# EAGLE design BPv3-LCDadapter-v2c (EAGLE 5.11)
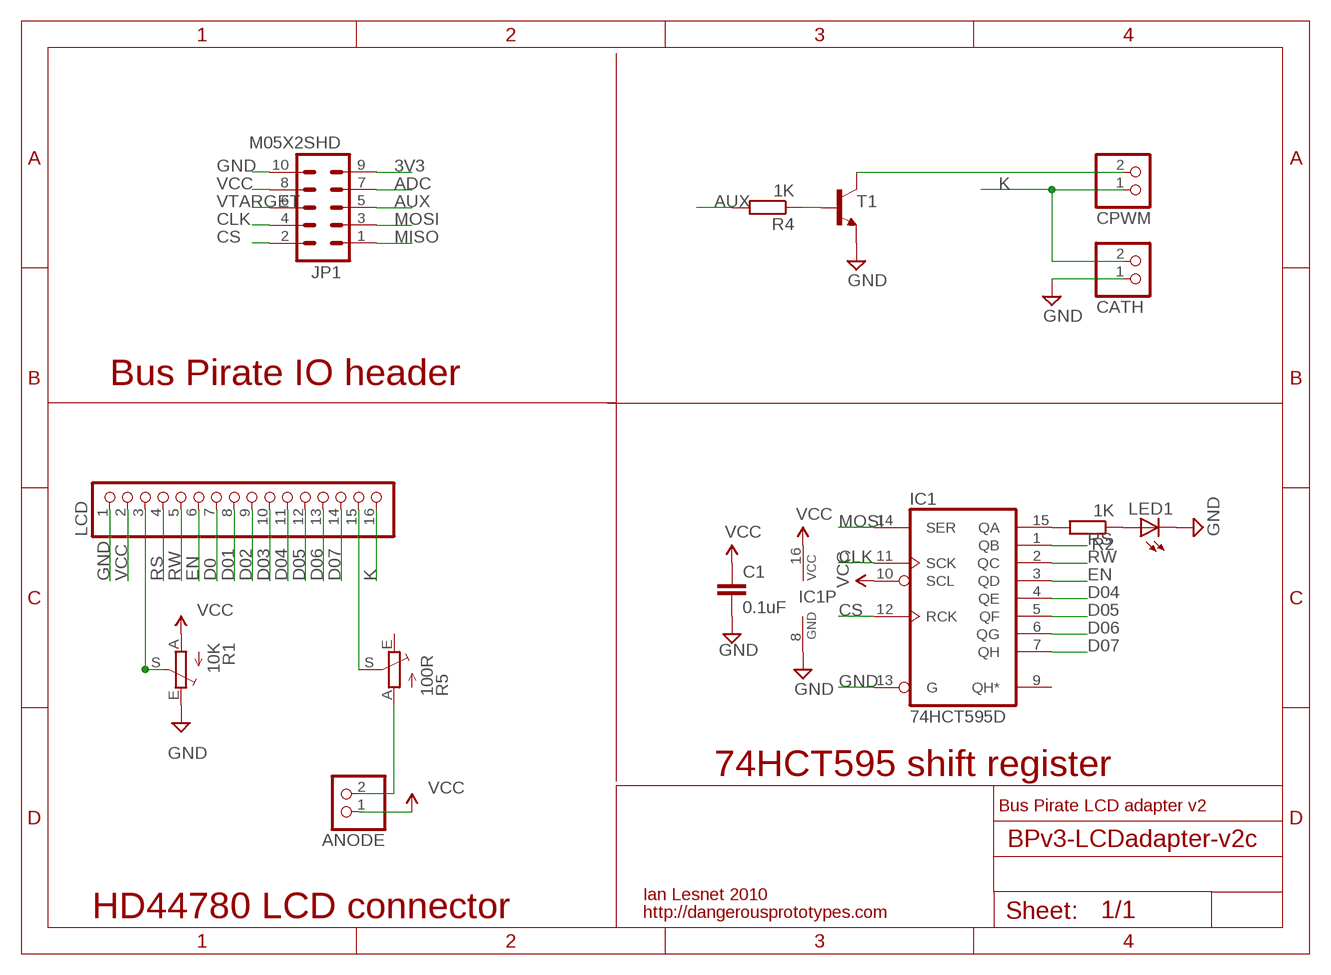
[diagram p0: schematic, sheet 1]

## Parts
ANODE  PINHD-1X2  [1X02]
C1  0.1uF  C-EUC0805  [C0805]
CATH  PINHD-1X2  [1X02]
CPWM  PINHD-1X2  [1X02]
IC1  74HCT595D  74HC595D  [SO16]
JP1  M05X2SHD  [2X5-SHROUDED]
LCD  PINHD-1X16  [1X16]
LED1  LEDCHIP-LED0805  [CHIP-LED0805]
R1  10K  TRIM_EU-CA6V  [CA6V]
R2  1K  R-EU_M0805  [M0805]
R4  1K  R-EU_M0805  [M0805]
R5  100R  TRIM_EU-CA6V  [CA6V]
T1  NPNSOT23BEC  [SOT23-BEC]

## Nets
3V3: JP1.9
ADC: JP1.7
AUX: JP1.5 R4.2
CLK: IC1.11(SCK) JP1.4
CS: IC1.12(RCK) JP1.2
D0: LCD.7
D01: LCD.8
D02: LCD.9
D03: LCD.10
D04: IC1.4(QE) LCD.11
D05: IC1.5(QF) LCD.12
D06: IC1.6(QG) LCD.13
D07: IC1.7(QH) LCD.14
EN: IC1.3(QD) LCD.6
GND: C1.2 CATH.1 IC1.8(GND) IC1.13(G) JP1.10 LCD.1 LED1.C R1.E T1.E
K: CATH.2 CPWM.1 LCD.16
MISO: JP1.1
MOSI: IC1.14(SER) JP1.3
N$1: IC1.15(QA) R2.2
N$2: LED1.A R2.1
N$3: ANODE.2 R5.A
N$4: LCD.15 R5.S
N$6: CPWM.2 T1.C
N$7: LCD.3 R1.S
N$8: R4.1 T1.B
RS: IC1.1(QB) LCD.4
RW: IC1.2(QC) LCD.5
VCC: ANODE.1 C1.1 IC1.10(SCL) IC1.16(VCC) JP1.8 LCD.2 R1.A
VTARGET: JP1.6
Unconnected: IC1.9(QH*) R5.E

## Notes on the sheet
- Bus Pirate IO header
- 74HCT595 shift register
- Bus Pirate LCD adapter v2
- Ian Lesnet 2010
- HD44780 LCD connector | http://dangerousprototypes.com

## Library data of the parts
ANODE CATH CPWM = pinhead - Copy:PINHD-1X2: PIN HEADER
C1 = rcl:C-EU: CAPACITOR, European symbol
IC1 = 74xx-eu:74*595: 8-bit SHIFT REGISTER, output latch
JP1 = SparkFun:M05X2: Header 5x2 Standard 10-pin dual row 0.1" header. Commonly used with AVR-ISP. Use with Spark Fun Electronics SKU: PRT-00778
LCD = pinhead:PINHD-1X16: PIN HEADER
LED1 = led:LED: LED OSRAM: - CHIPLED LG R971, LG N971, LY N971, LG Q971, LY Q971, LO R971, LY R971 LH N974, LH R974 LS Q976, LO Q976, LY Q976 LO Q996 - Hyper CHIPLED LW Q18S LB Q993, LB Q99A, LB R99A - SideLED LS A670, LO A670, LY A670, LG A670, LP A670 LB A673, LV A673, LT A673, LW A673 LH A674 LY A675 LS A676, LA A676, LO A676, LY A676, LW A676 LS A679, LY A679, LG A679 - Hyper Micro SIDELED® LS Y876, LA Y876, LO Y876, LY Y876 LT Y87S - SmartLED LW L88C, LW L88S LB L89C, LB L89S, LG L890 LS L89K, LO L89K, LY L89K LS L896, LA L896, LO L896, LY L896 - TOPLED LS T670, LO T670, LY T670, LG T670, LP T670 LSG T670, LSP T670, LSY T670, LOP T670, LYG T670 LG T671, LOG T671, LSG T671 LB T673, LV T673, LT T673, LW T673 LH T674 LS T676, LA T676, LO T676, LY T676, LB T676, LH T676, LSB T676, LW T676 LB T67C, LV T67C, LT T67C, LS T67K, LO T67K, LY T67K, LW E67C LS E67B, LA E67B, LO E67B, LY E67B, LB E67C, LV E67C, LT E67C LW T67C LS T679, LY T679, LG T679 LS T770, LO T770, LY T770, LG T770, LP T770 LB T773, LV T773, LT T773, LW T773 LH T774 LS E675, LA E675, LY E675, LS T675 LS T776, LA T776, LO T776, LY T776, LB T776 LHGB T686 LT T68C, LB T68C - Hyper Mini TOPLED® LB M676 - Mini TOPLED Santana® LG M470 LS M47K, LO M47K, LY M47K Source: http://www.osram.convergy.de LUXEON: - LUMILED® LXK2-PW12-R00, LXK2-PW12-S00, LXK2-PW14-U00, LXK2-PW14-V00 LXK2-PM12-R00, LXK2-PM12-S00, LXK2-PM14-U00 LXK2-PE12-Q00, LXK2-PE12-R00, LXK2-PE12-S00, LXK2-PE14-T00, LXK2-PE14-U00 LXK2-PB12-K00, LXK2-PB12-L00, LXK2-PB12-M00, LXK2-PB14-N00, LXK2-PB14-P00, LXK2-PB14-Q00 LXK2-PR12-L00, LXK2-PR12-M00, LXK2-PR14-Q00, LXK2-PR14-R00 LXK2-PD12-Q00, LXK2-PD12-R00, LXK2-PD12-S00 LXK2-PH12-R00, LXK2-PH12-S00 LXK2-PL12-P00, LXK2-PL12-Q00, LXK2-PL12-R00 Source: www.luxeon.com KINGBRIGHT: KA-3528ASYC Source: www.kingbright.com
R1 R5 = pot:TRIM_EU-: POTENTIOMETER
R2 R4 = rcl:R-EU_: RESISTOR, European symbol
T1 = dp_devices:NPN: Most commonly used is SOT23-BEC

## Board
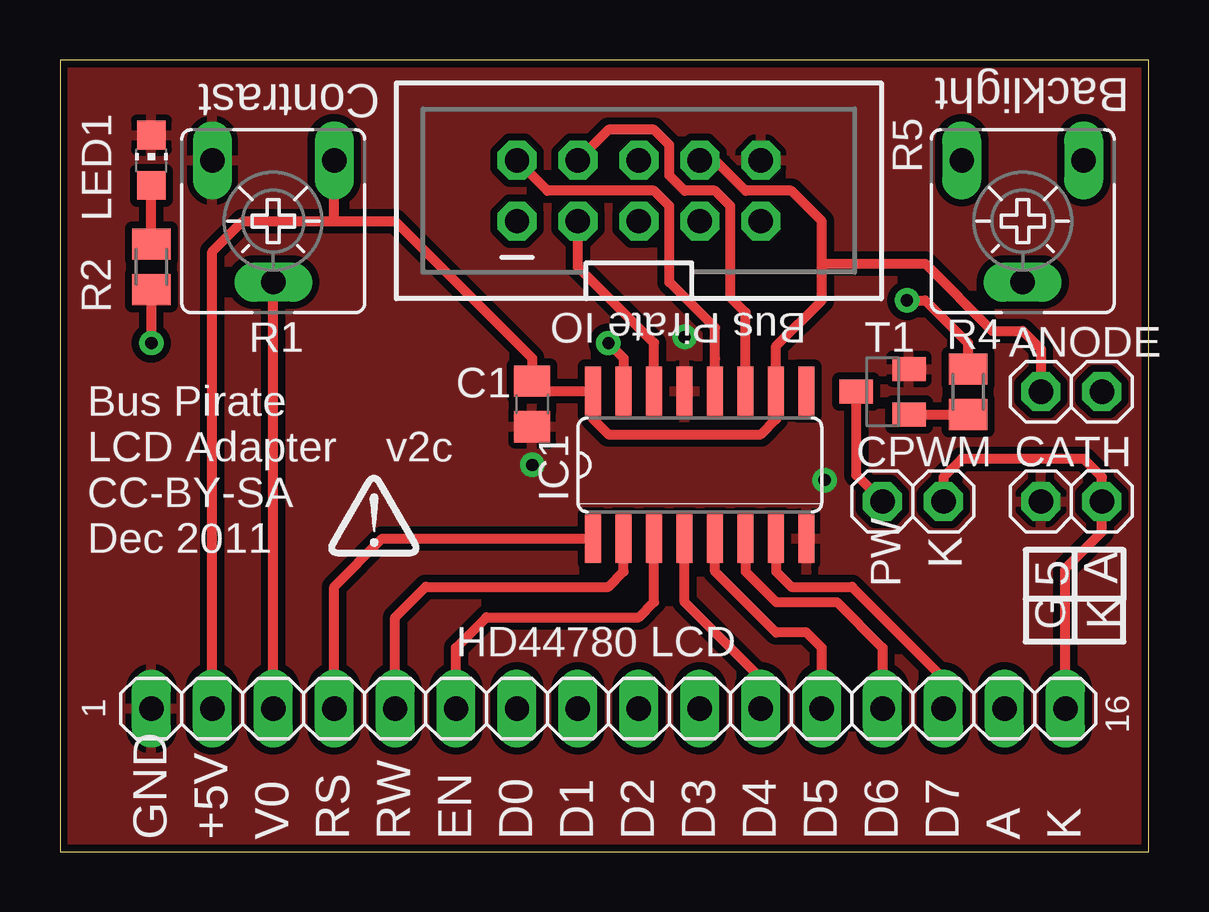
[diagram p1: board, top side]
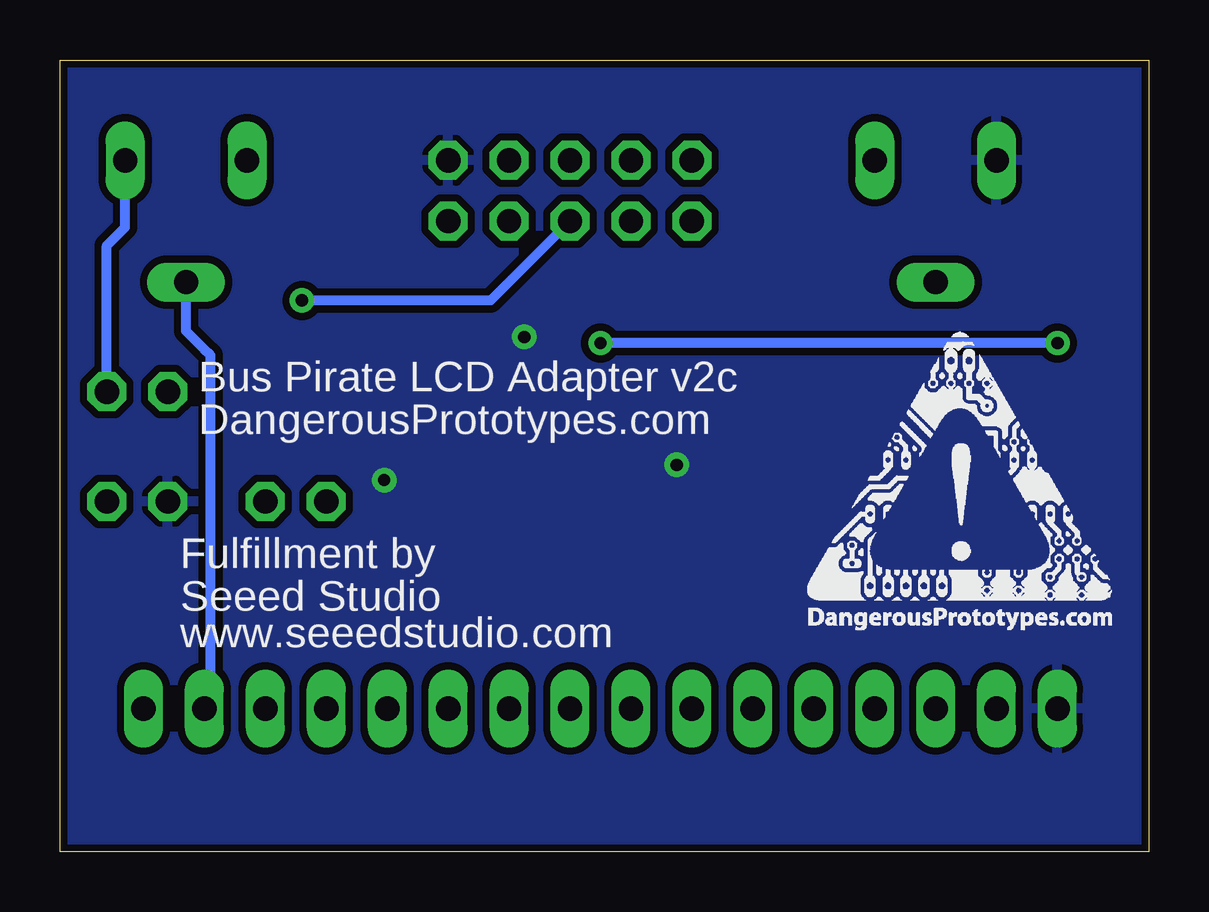
[diagram p2: board, bottom side, seen from below]

Size 45.39 x 33.01 mm. Coordinates in mm from the lower left corner, seen from the top.
Outline: 0,0 45.39,0 45.39,33.01 0,33.01 0,0
Copper layers (1*16): Top 0.035mm / dielectric 1.5mm / Bottom 0.035mm
Design rules "SparkFun": minimum track width 8mil, minimum drill 20mil, track to track 8mil, track to pad 8mil, pad to pad 8mil, via to via 8mil, smd to smd 8mil, copper to edge 10mil, drill to drill 8mil, minimum pad ring 12mil, minimum via ring 10mil, stop-mask expansion 4mil, vias tented up to drill 25mil, thermal gap 10mil

### Footprints (pad centres in the part's own frame; a part is rotated, then mirrored left to right if it is on the bottom)
1X02 = drill 1.016 octagon: 1 -1.27,0; 2 1.27,0
C0805 = smd 1.3 x 1.5: 1 -0.95,0; 2 0.95,0
SO16 = smd 0.66 x 2.032: 1 -4.445,-3.073; 2 -3.175,-3.073; 3 -1.905,-3.073; 4 -0.635,-3.073; 5 0.635,-3.073; 6 1.905,-3.073; 7 3.175,-3.073; 8 4.445,-3.073; 9 4.445,3.073; 10 3.175,3.073; 11 1.905,3.073; 12 0.635,3.073; 13 -0.635,3.073; 14 -1.905,3.073; 15 -3.175,3.073; 16 -4.445,3.073
2X5-SHROUDED = drill 1.016 octagon: 1 -1.27,5.08; 2 1.27,5.08; 3 -1.27,2.54; 4 1.27,2.54; 5 -1.27,0; 6 1.27,0; 7 -1.27,-2.54; 8 1.27,-2.54; 9 -1.27,-5.08; 10 1.27,-5.08
1X16 = drill 1.016 long: 1 -19.05,0; 2 -16.51,0; 3 -13.97,0; 4 -11.43,0; 5 -8.89,0; 6 -6.35,0; 7 -3.81,0; 8 -1.27,0; 9 1.27,0; 10 3.81,0; 11 6.35,0; 12 8.89,0; 13 11.43,0; 14 13.97,0; 15 16.51,0; 16 19.05,0
CHIP-LED0805 = smd 1.2 x 1.2: A 0,-1.05; C 0,1.05
CA6V = drill 1.016 long: A -2.54,-2.54; E 2.54,-2.54; S 0,2.54
M0805 = smd 1.3 x 1.6: 1 -0.95,0; 2 0.95,0
SOT23-BEC = smd 1 x 1.4: B -0.95,-1.1; C 0,1.1; E 0.95,-1.1

### Placement (x,y rotation side)
ANODE  42.16,19.18 0 top
C1  19.69,18.67 270 top
CATH  42.16,14.61 0 top
CPWM  35.56,14.61 180 top
IC1  26.67,16.13 0 top
JP1  24.13,27.56 90 top
LCD  22.86,5.97 0 top
LED1  3.81,28.83 0 top
R1  8.89,26.29 180 top
R2  3.81,24.38 270 top
R4  37.85,19.18 90 top
R5  40.13,26.29 180 top
T1  34.29,19.18 90 top
U$1  [DP_LOGO]  13.08,12.95 0 top
U$4  [DP_LOGO_ART_0.5X0.5]  14.22,9.27 0 bottom

### Tracks (layer width: path | path; a pad name or v marks a point on that pad's centre or on a via)
AUX  (via drill 0.51)
  Top 0.406: v35.31,22.99 36.07,22.99 37.85,21.21 R4.2
  Bottom 0.406: v35.31,22.99 27.43,22.99 JP1.5
CLK
  Top 0.406: JP1.4 22.86,30.1 24.77,30.1 25.4,29.46 25.4,28.19 26.03,27.56 27.3,27.56 27.94,26.92 27.94,23.11 28.57,22.48 IC1.11
CS
  Top 0.406: 27.3,20.57 IC1.12 27.3,21.84 25.4,23.75 25.4,26.92 24.77,27.56 20.32,27.56 JP1.2
D04
  Top 0.406: IC1.4 26.03,10.41 29.2,7.24 29.21,7.24 LCD.11
D05
  Top 0.406: 31.74,7.24 31.74,6.6 31.75,6.61 | IC1.5 27.3,11.68 29.84,9.14 31.12,9.14 31.75,8.51 31.75,6.61 | 31.75,6.61 LCD.12
D06
  Top 0.406: IC1.6 28.57,11.68 29.84,10.41 32.38,10.41 34.29,8.51 LCD.13
D07
  Top 0.406: IC1.7 29.84,11.68 30.48,11.05 33.02,11.05 36.83,7.24 LCD.14
EN
  Top 0.406: IC1.3 24.77,10.41 24.13,9.78 17.78,9.78 16.51,8.51 LCD.6
GND  (via drill 0.51)
  other vias: 26.03,21.46 31.88,15.49 19.69,16.13
  pour Bottom (isolate 0.305): 0,33.02 45.72,33.02 45.72,0 0,0
  pour Top (isolate 0.305): 0,33.02 45.72,33.02 45.72,0 0,0
K
  Top 0.406: LCD.16 41.91,11.81 43.43,13.34 CATH.2 43.43,15.62 42.67,16.38 37.59,16.38 36.83,15.62 CPWM.1
MOSI
  Top 0.406: JP1.3 21.59,24.38 24.77,21.21 IC1.14
N$1  (via drill 0.51)
  Top 0.406: R2.2 v3.81,21.21 | v22.86,21.21 23.49,20.57 IC1.15
  Bottom 0.406: v3.81,21.21 v22.86,21.21
N$2
  Top 0.406: R2.1 LED1.A
N$3
  Bottom 0.406: ANODE.2 43.43,25.27 42.67,26.04 R5.A
N$4
  Bottom 0.406: LCD.15 39.12,5.97 39.12,20.7 39.37,20.96 40.13,21.72 R5.S
N$6
  Top 0.406: T1.C 33.19,15.71 CPWM.2
N$7
  Top 0.406: R1.S 9.53,23.75 8.89,23.11 LCD.3
N$8
  Top 0.406: T1.B R4.1
RS
  Top 0.406: IC1.1 13.44,13.06 11.43,11.05 LCD.4
RW
  Top 0.406: IC1.2 23.49,11.68 22.86,11.05 15.24,11.05 13.97,9.78 LCD.5
VCC
  Top 0.406: C1.1 20.1,19.2 IC1.16 22.23,18.03 22.86,17.4 29.21,17.4 29.84,18.03 IC1.10 29.84,21.08 31.75,22.99 31.75,24.51 | 11.43,26.29 R1.A | JP1.8 27.3,28.83 28.57,27.56 30.48,27.56 31.75,26.29 31.75,24.51 | 11.43,26.29 7.62,26.29 6.35,25.02 LCD.2 | C1.1 19.37,19.94 | C1.1 19.69,20.57 13.97,26.29 11.43,26.29 | ANODE.1 40.89,20.96 40.13,21.72 38.86,21.72 36.07,24.51 31.75,24.51

### Text on the board
tNames: Contrast | Backlight | Bus Pirate IO | Bus Pirate | LCD Adapter | v2c | CC-BY-SA | Dec 2011 | K | PW | 5 | A | G | K | HD44780 LCD | 1 | 16 | GND | +5V | V0 | RS | RW | EN | D0 | D1 | D2 | D3 | D4 | D5 | D6 | D7 | A | K
bNames: Bus Pirate LCD Adapter v2c | DangerousPrototypes.com | Fulfillment by | Seeed Studio | www.seeedstudio.com